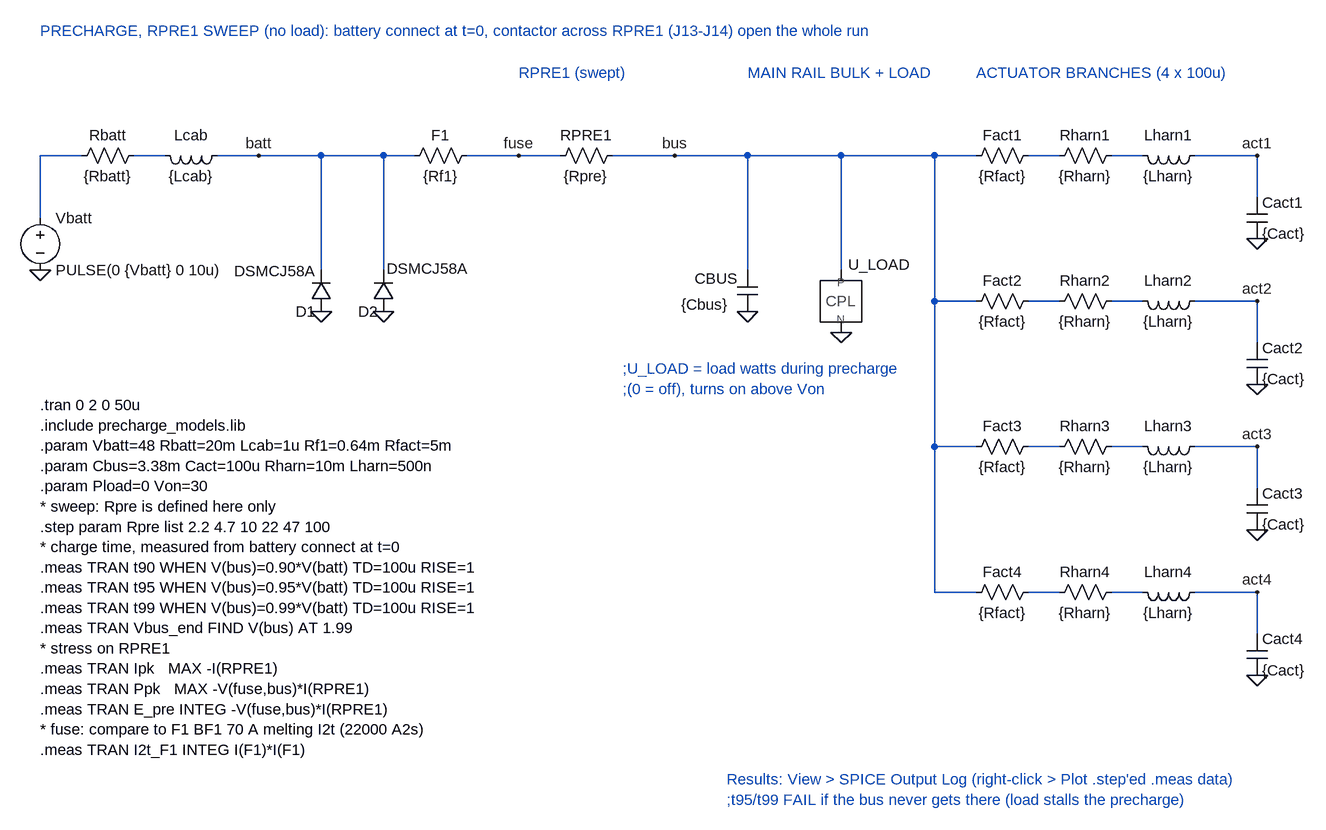
[diagram p0: schematic precharge_resistor_sweep.asc]
precharge_resistor_sweep.asc, the LTspice schematic file:
Version 4.1
SHEET 1 2400 1600
WIRE 64 64 0 64
WIRE 192 64 144 64
WIRE 336 64 272 64
WIRE 432 64 336 64
WIRE 528 64 432 64
WIRE 576 64 528 64
WIRE 736 64 656 64
WIRE 800 64 736 64
WIRE 976 64 880 64
WIRE 1088 64 976 64
WIRE 1232 64 1088 64
WIRE 1376 64 1232 64
WIRE 1440 64 1376 64
WIRE 1568 64 1520 64
WIRE 1696 64 1648 64
WIRE 1872 64 1776 64
WIRE 1872 128 1872 64
WIRE 0 160 0 64
WIRE 432 240 432 64
WIRE 528 240 528 64
WIRE 1088 240 1088 64
WIRE 1232 240 1232 64
WIRE 1376 288 1376 64
WIRE 1440 288 1376 288
WIRE 1568 288 1520 288
WIRE 1696 288 1648 288
WIRE 1872 288 1776 288
WIRE 1872 352 1872 288
WIRE 1376 512 1376 288
WIRE 1440 512 1376 512
WIRE 1568 512 1520 512
WIRE 1696 512 1648 512
WIRE 1872 512 1776 512
WIRE 1872 576 1872 512
WIRE 1376 736 1376 512
WIRE 1440 736 1376 736
WIRE 1568 736 1520 736
WIRE 1696 736 1648 736
WIRE 1872 736 1776 736
WIRE 1872 800 1872 736
FLAG 0 240 0
FLAG 336 64 batt
FLAG 432 304 0
FLAG 528 304 0
FLAG 736 64 fuse
FLAG 976 64 bus
FLAG 1088 304 0
FLAG 1232 336 0
FLAG 1872 64 act1
FLAG 1872 192 0
FLAG 1872 288 act2
FLAG 1872 416 0
FLAG 1872 512 act3
FLAG 1872 640 0
FLAG 1872 736 act4
FLAG 1872 864 0
SYMBOL voltage 0 144 R0
SYMATTR InstName Vbatt
SYMATTR Value PULSE(0 {Vbatt} 0 10u)
SYMBOL res 160 48 R90
WINDOW 0 0 56 VBottom 2
WINDOW 3 32 56 VTop 2
SYMATTR InstName Rbatt
SYMATTR Value {Rbatt}
SYMBOL ind 288 48 R90
WINDOW 0 0 56 VBottom 2
WINDOW 3 32 56 VTop 2
SYMATTR InstName Lcab
SYMATTR Value {Lcab}
SYMBOL diode 448 304 R180
WINDOW 3 24 62 Left 2
SYMATTR Value DSMCJ58A
SYMATTR InstName D1
SYMBOL diode 544 304 R180
WINDOW 3 -114 66 Left 2
SYMATTR Value DSMCJ58A
SYMATTR InstName D2
SYMBOL res 672 48 R90
WINDOW 0 0 56 VBottom 2
WINDOW 3 32 56 VTop 2
SYMATTR InstName F1
SYMATTR Value {Rf1}
SYMBOL res 896 48 R90
WINDOW 0 0 56 VBottom 2
WINDOW 3 32 56 VTop 2
SYMATTR InstName RPRE1
SYMATTR Value {Rpre}
SYMBOL cap 1072 240 R0
WINDOW 0 -65 13 Left 2
WINDOW 3 -86 53 Left 2
SYMATTR InstName CBUS
SYMATTR Value {Cbus}
SYMATTR SpiceLine Rser=10m Lser=10n
SYMBOL CPLen_beh 1232 240 R0
WINDOW 0 11 -8 Left 2
SYMATTR InstName U_LOAD
SYMBOL res 1536 48 R90
WINDOW 0 0 56 VBottom 2
WINDOW 3 32 56 VTop 2
SYMATTR InstName Fact1
SYMATTR Value {Rfact}
SYMBOL res 1664 48 R90
WINDOW 0 0 56 VBottom 2
WINDOW 3 32 56 VTop 2
SYMATTR InstName Rharn1
SYMATTR Value {Rharn}
SYMBOL ind 1792 48 R90
WINDOW 0 0 56 VBottom 2
WINDOW 3 32 56 VTop 2
SYMATTR InstName Lharn1
SYMATTR Value {Lharn}
SYMBOL cap 1856 128 R0
SYMATTR InstName Cact1
SYMATTR Value {Cact}
SYMATTR SpiceLine Rser=20m Lser=10n
SYMBOL res 1536 272 R90
WINDOW 0 0 56 VBottom 2
WINDOW 3 32 56 VTop 2
SYMATTR InstName Fact2
SYMATTR Value {Rfact}
SYMBOL res 1664 272 R90
WINDOW 0 0 56 VBottom 2
WINDOW 3 32 56 VTop 2
SYMATTR InstName Rharn2
SYMATTR Value {Rharn}
SYMBOL ind 1792 272 R90
WINDOW 0 0 56 VBottom 2
WINDOW 3 32 56 VTop 2
SYMATTR InstName Lharn2
SYMATTR Value {Lharn}
SYMBOL cap 1856 352 R0
SYMATTR InstName Cact2
SYMATTR Value {Cact}
SYMATTR SpiceLine Rser=20m Lser=10n
SYMBOL res 1536 496 R90
WINDOW 0 0 56 VBottom 2
WINDOW 3 32 56 VTop 2
SYMATTR InstName Fact3
SYMATTR Value {Rfact}
SYMBOL res 1664 496 R90
WINDOW 0 0 56 VBottom 2
WINDOW 3 32 56 VTop 2
SYMATTR InstName Rharn3
SYMATTR Value {Rharn}
SYMBOL ind 1792 496 R90
WINDOW 0 0 56 VBottom 2
WINDOW 3 32 56 VTop 2
SYMATTR InstName Lharn3
SYMATTR Value {Lharn}
SYMBOL cap 1856 576 R0
SYMATTR InstName Cact3
SYMATTR Value {Cact}
SYMATTR SpiceLine Rser=20m Lser=10n
SYMBOL res 1536 720 R90
WINDOW 0 0 56 VBottom 2
WINDOW 3 32 56 VTop 2
SYMATTR InstName Fact4
SYMATTR Value {Rfact}
SYMBOL res 1664 720 R90
WINDOW 0 0 56 VBottom 2
WINDOW 3 32 56 VTop 2
SYMATTR InstName Rharn4
SYMATTR Value {Rharn}
SYMBOL ind 1792 720 R90
WINDOW 0 0 56 VBottom 2
WINDOW 3 32 56 VTop 2
SYMATTR InstName Lharn4
SYMATTR Value {Lharn}
SYMBOL cap 1856 800 R0
SYMATTR InstName Cact4
SYMATTR Value {Cact}
SYMATTR SpiceLine Rser=20m Lser=10n
TEXT 0 -128 Left 2 ;PRECHARGE, RPRE1 SWEEP (no load): battery connect at t=0, contactor across RPRE1 (J13-J14) open the whole run
TEXT 736 -64 Left 2 ;RPRE1 (swept)
TEXT 1088 -64 Left 2 ;MAIN RAIL BULK + LOAD
TEXT 1440 -64 Left 2 ;ACTUATOR BRANCHES (4 x 100u)
TEXT 896 392 Left 2 ;;U_LOAD = load watts during precharge\n;(0 = off), turns on above Von
TEXT 0 448 Left 2 !.tran 0 2 0 50u\n.include precharge_models.lib\n.param Vbatt=48 Rbatt=20m Lcab=1u Rf1=0.64m Rfact=5m\n.param Cbus=3.38m Cact=100u Rharn=10m Lharn=500n\n.param Pload=0 Von=30\n* sweep: Rpre is defined here only\n.step param Rpre list 2.2 4.7 10 22 47 100\n* charge time, measured from battery connect at t=0\n.meas TRAN t90 WHEN V(bus)=0.90*V(batt) TD=100u RISE=1\n.meas TRAN t95 WHEN V(bus)=0.95*V(batt) TD=100u RISE=1\n.meas TRAN t99 WHEN V(bus)=0.99*V(batt) TD=100u RISE=1\n.meas TRAN Vbus_end FIND V(bus) AT 1.99\n* stress on RPRE1\n.meas TRAN Ipk   MAX -I(RPRE1)\n.meas TRAN Ppk   MAX -V(fuse,bus)*I(RPRE1)\n.meas TRAN E_pre INTEG -V(fuse,bus)*I(RPRE1)\n* fuse: compare to F1 BF1 70 A melting I2t (22000 A2s)\n.meas TRAN I2t_F1 INTEG I(F1)*I(F1)
TEXT 1056 1024 Left 2 ;Results: View > SPICE Output Log (right-click > Plot .step'ed .meas data)\n;t95/t99 FAIL if the bus never gets there (load stalls the precharge)

The netlist it stands for:
* precharge_resistor_sweep.asc
Vbatt N001 0 PULSE(0 {Vbatt} 0 10u)
Rbatt N002 N001 {Rbatt}
Lcab batt N002 {Lcab}
D1 0 batt DSMCJ58A
D2 0 batt DSMCJ58A
R§F1 fuse batt {Rf1}
RPRE1 bus fuse {Rpre}
CBUS bus 0 {Cbus} Rser=10m Lser=10n
X§U_LOAD bus 0 CPL_EN_BEH CPL_EN_BEH  ; pins P N
R§Fact1 N003 bus {Rfact}
Rharn1 N004 N003 {Rharn}
Lharn1 act1 N004 {Lharn}
Cact1 act1 0 {Cact} Rser=20m Lser=10n
R§Fact2 N005 bus {Rfact}
Rharn2 N006 N005 {Rharn}
Lharn2 act2 N006 {Lharn}
Cact2 act2 0 {Cact} Rser=20m Lser=10n
R§Fact3 N007 bus {Rfact}
Rharn3 N008 N007 {Rharn}
Lharn3 act3 N008 {Lharn}
Cact3 act3 0 {Cact} Rser=20m Lser=10n
R§Fact4 N009 bus {Rfact}
Rharn4 N010 N009 {Rharn}
Lharn4 act4 N010 {Lharn}
Cact4 act4 0 {Cact} Rser=20m Lser=10n
.model D D
.lib standard.dio
* PRECHARGE, RPRE1 SWEEP (no load): battery connect at t=0, contactor across RPRE1 (J13-J14) open the whole run
* RPRE1 (swept)
* MAIN RAIL BULK + LOAD
* ACTUATOR BRANCHES (4 x 100u)
* ;U_LOAD = load watts during precharge
* ;(0 = off), turns on above Von
.tran 0 2 0 50u
.include precharge_models.lib
.param Vbatt=48 Rbatt=20m Lcab=1u Rf1=0.64m Rfact=5m
.param Cbus=3.38m Cact=100u Rharn=10m Lharn=500n
.param Pload=0 Von=30
* sweep: Rpre is defined here only
.step param Rpre list 2.2 4.7 10 22 47 100
* charge time, measured from battery connect at t=0
.meas TRAN t90 WHEN V(bus)=0.90*V(batt) TD=100u RISE=1
.meas TRAN t95 WHEN V(bus)=0.95*V(batt) TD=100u RISE=1
.meas TRAN t99 WHEN V(bus)=0.99*V(batt) TD=100u RISE=1
.meas TRAN Vbus_end FIND V(bus) AT 1.99
* stress on RPRE1
.meas TRAN Ipk   MAX -I(RPRE1)
.meas TRAN Ppk   MAX -V(fuse,bus)*I(RPRE1)
.meas TRAN E_pre INTEG -V(fuse,bus)*I(RPRE1)
* fuse: compare to F1 BF1 70 A melting I2t (22000 A2s)
.meas TRAN I2t_F1 INTEG I(F1)*I(F1)
* Results: View > SPICE Output Log (right-click > Plot .step'ed .meas data)
* ;t95/t99 FAIL if the bus never gets there (load stalls the precharge)
.backanno
.end